# Altium schematic sheet StepperPlotter.SchDoc
size C; SheetNumber: 1; SheetTotal: 1
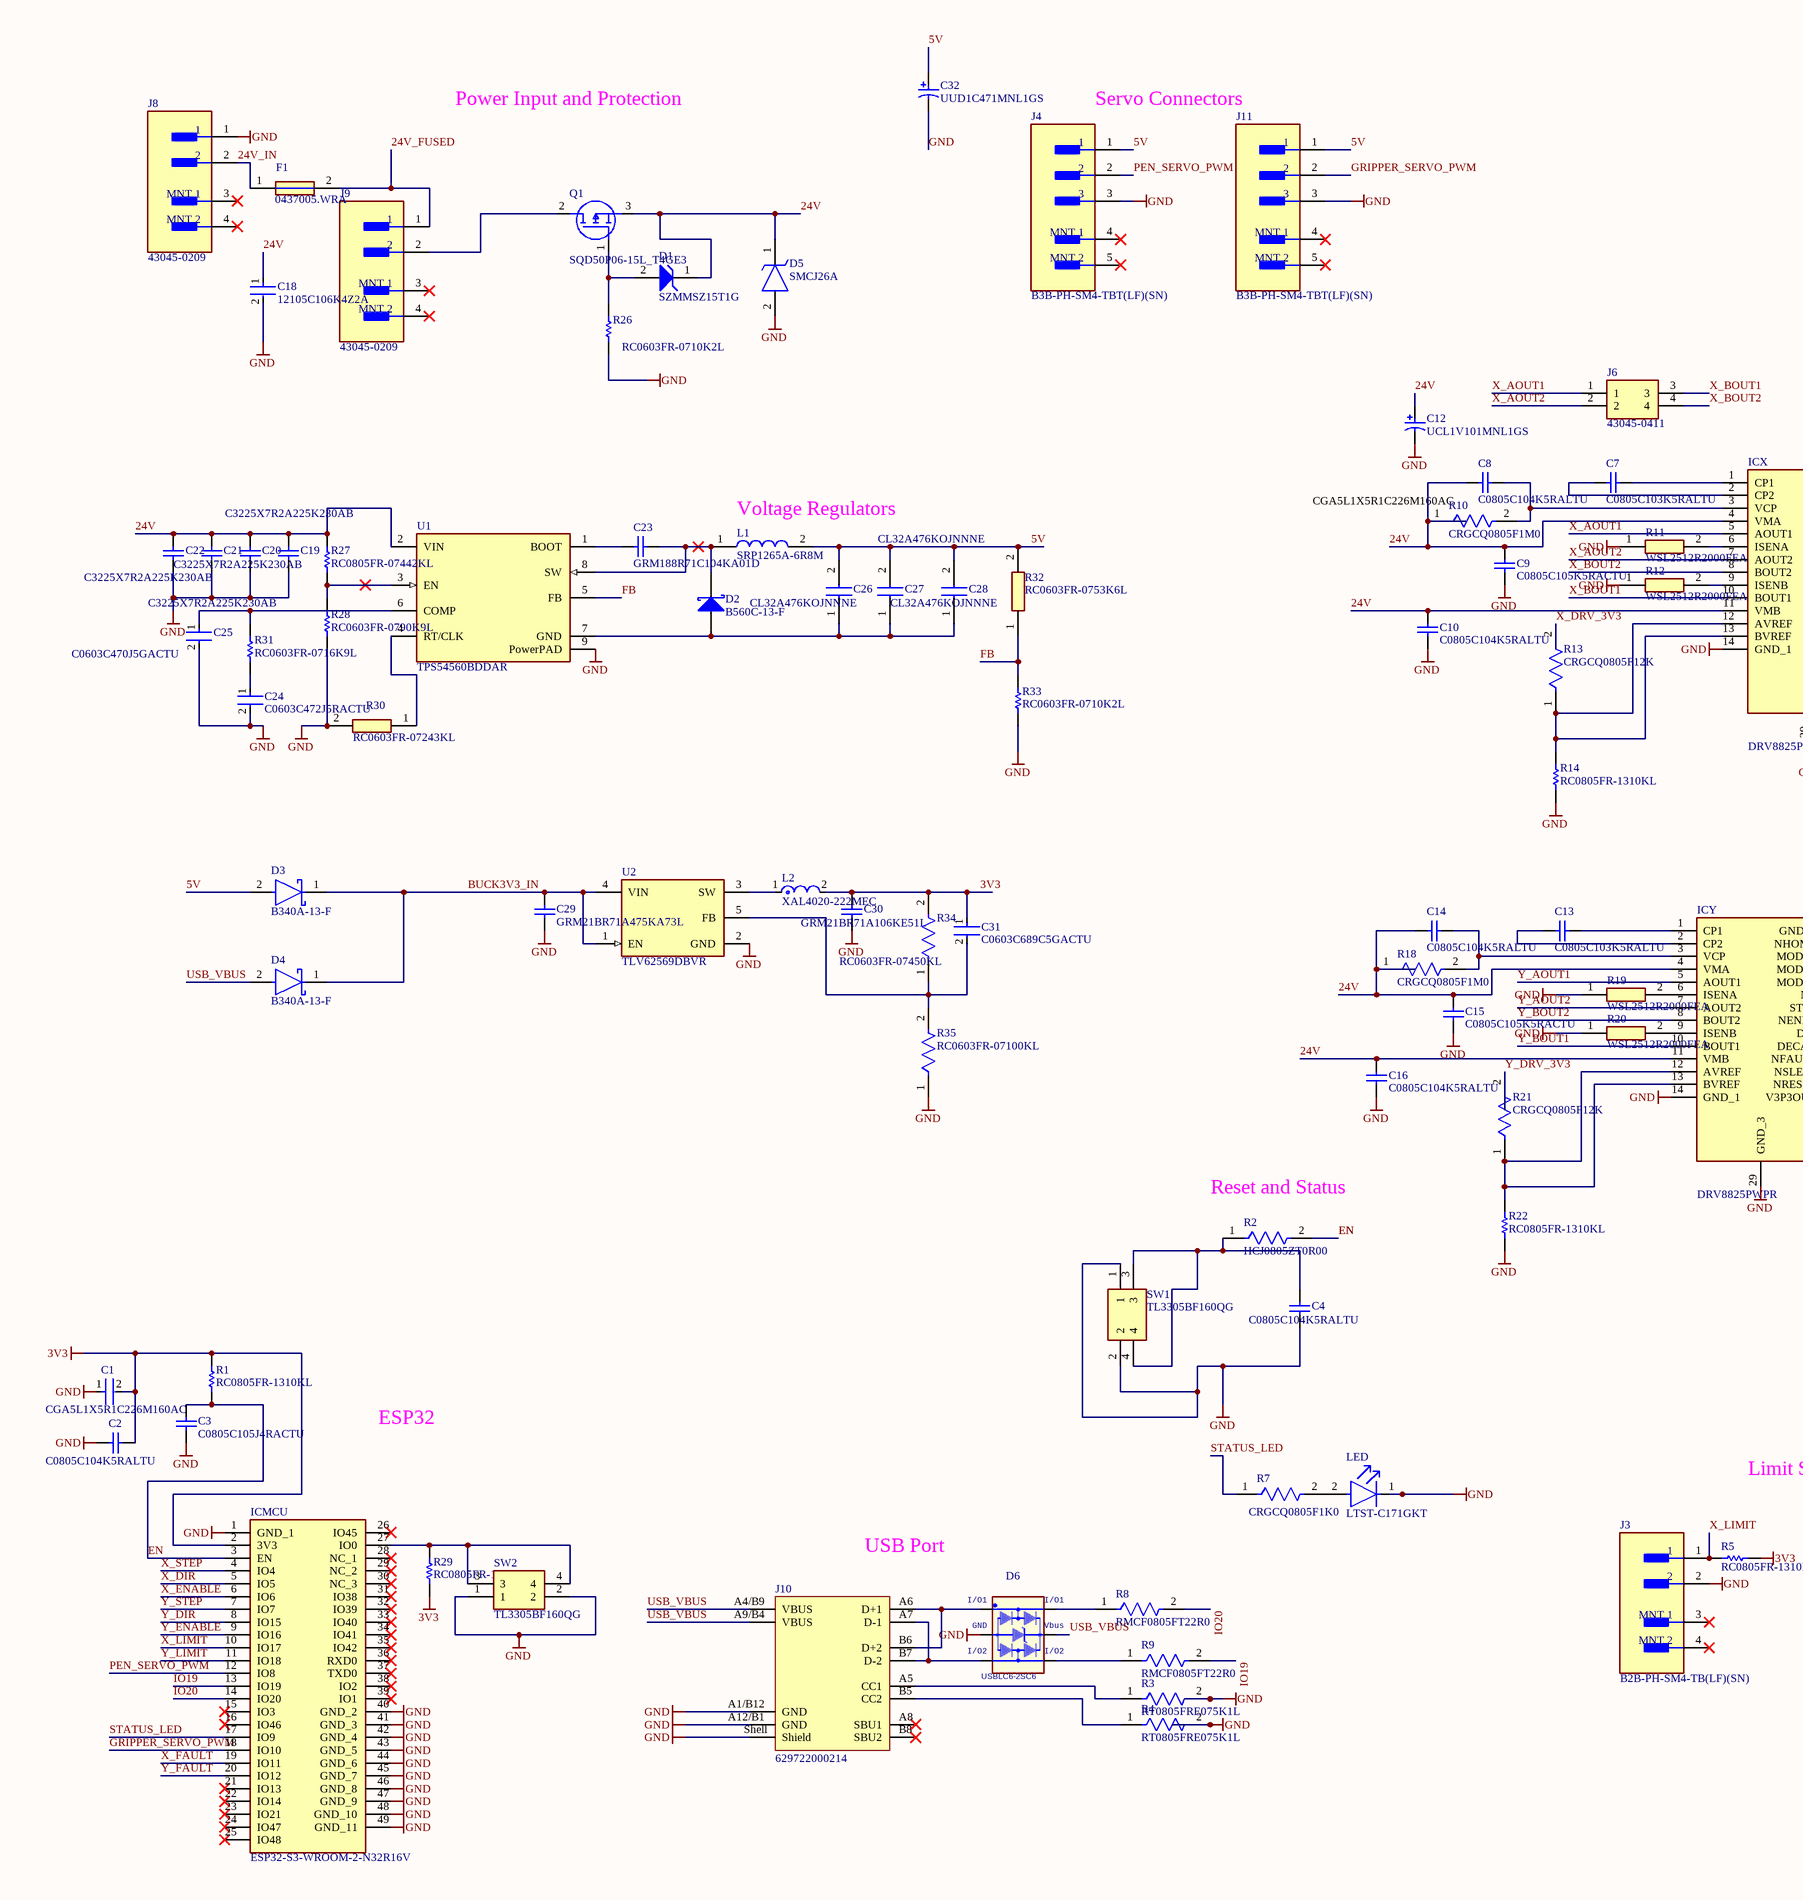
[diagram p0: StepperPlotter.SchDoc, left]
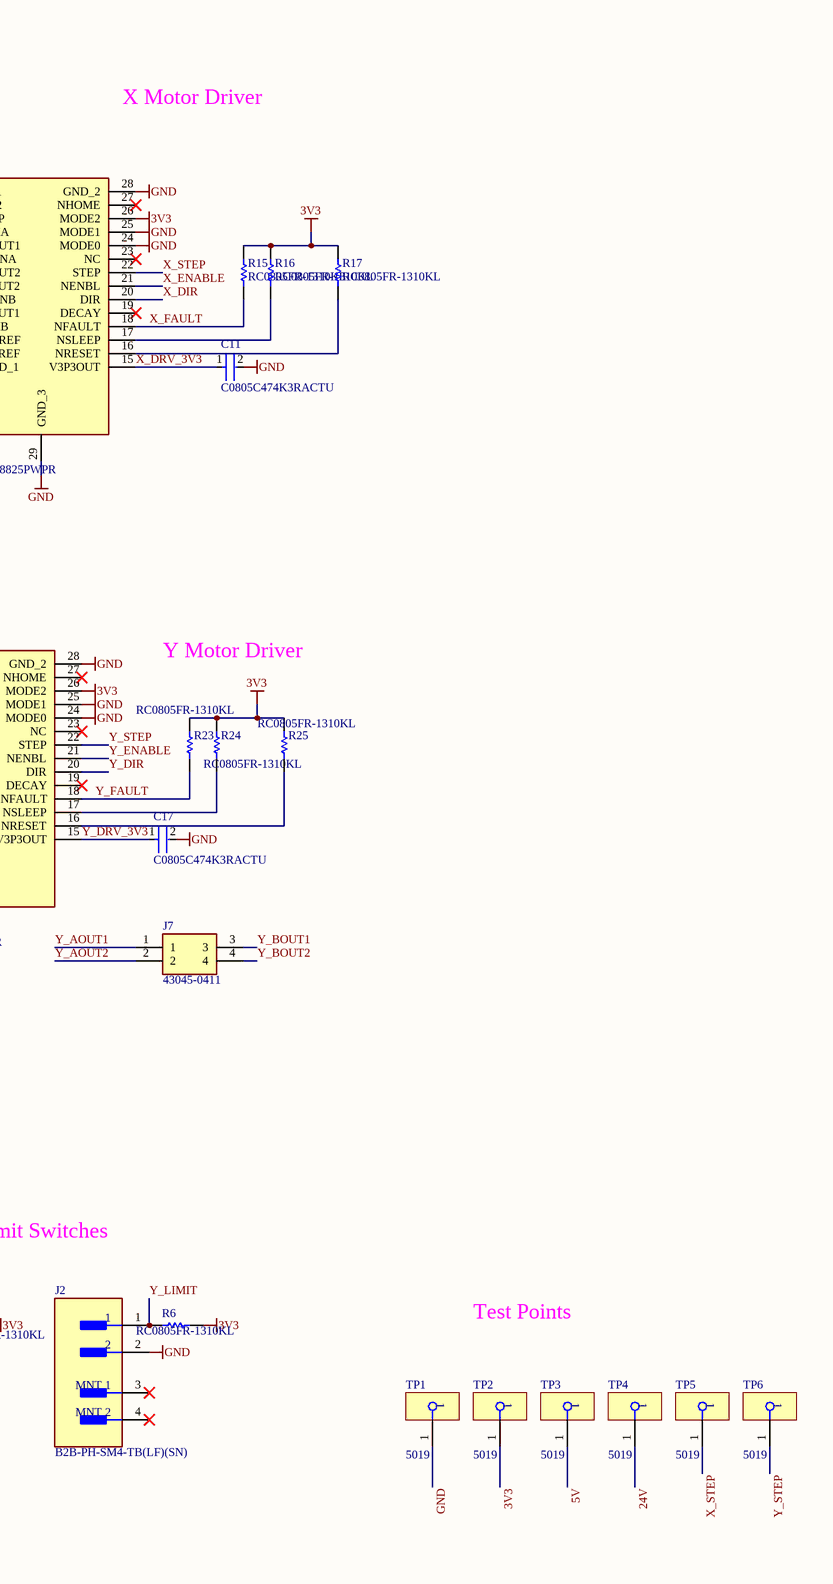
[diagram p1: StepperPlotter.SchDoc, right]

## Parts
C1  CGA5L1X5R1C226M160AC  [FP-CGA5L-0_3-0_1-IPC_A]
C2  C0805C104K5RALTU  [CAPC2013X88X50LL20T25]
C3  C0805C105J4RACTU  [CAPC2013X140X50NL20T25]
C4  C0805C104K5RALTU  [CAPC2013X88X50LL20T25]
C7  C0805C103K5RALTU  [CAPC2013X145X50LL20T25]
C8  C0805C104K5RALTU  [CAPC2013X88X50LL20T25]
C9  C0805C105K5RACTU  [CAPC2013X140X50ML20T25]
C10  C0805C104K5RALTU  [CAPC2013X88X50LL20T25]
C11  C0805C474K3RACTU  [FP-C0805C-DN-MFG]
C12  UCL1V101MNL1GS  [NIC-UCL1V101MNL1GS_L]
C13  C0805C103K5RALTU  [CAPC2013X145X50LL20T25]
C14  C0805C104K5RALTU  [CAPC2013X88X50LL20T25]
C15  C0805C105K5RACTU  [CAPC2013X140X50ML20T25]
C16  C0805C104K5RALTU  [CAPC2013X88X50LL20T25]
C17  C0805C474K3RACTU  [FP-C0805C-DN-MFG]
C18  12105C106K4Z2A  [FP-12105C106K4Z2A-MFG]
C19  C3225X7R2A225K230AB  [CAPC3225X250X20LL40]
C20  C3225X7R2A225K230AB  [CAPC3225X250X20LL40]
C21  C3225X7R2A225K230AB  [CAPC3225X250X20LL40]
C22  C3225X7R2A225K230AB  [CAPC3225X250X20LL40]
C23  GRM188R71C104KA01D  [MURA-0603_H_0.9_M]
C24  C0603C472J5RACTU  [FP-C0603C-CF-MFG]
C25  C0603C470J5GACTU  [FP-C0603C-CF-MFG]
C26  CL32A476KOJNNNE  [CAPC3225X270N]
C27  CL32A476KOJNNNE  [CAPC3225X270N]
C28  CL32A476KOJNNNE  [CAPC3225X270N]
C29  GRM21BR71A475KA73L  [CAPC2013X135X45LL10T25]
C30  GRM21BR71A106KE51L  [CAPC2013X140X45NL15T25]
C31  C0603C689C5GACTU  [FP-C0603C-CF-MFG]
C32  UUD1C471MNL1GS  [NIC-CAPA2-8X10_V]
D1  SZMMSZ15T1G  [ONSC-SOD-123-2-425-04_V]
D2  B560C-13-F  [DIOD-B5X0C-2_M]
D3  B340A-13-F  [FP-SMA-MFG]
D4  B340A-13-F  [FP-SMA-MFG]
D5  SMCJ26A  [SMCJ26A]
D6  USBLC6-2SC6  [ST_SOT23-6L]
F1  0437005.WRA  [FUSC3216X98N]
ICMCU  ESP32-S3-WROOM-2-N32R16V  [ESP32S3WROOM2N32R16V]
ICX  DRV8825PWPR  [SOP65P640X120-29N]
ICY  DRV8825PWPR  [SOP65P640X120-29N]
J2  B2B-PH-SM4-TB(LF)(SN)  [FP-B2B-PH-SM4-TB_LF_SN-MFG]
J3  B2B-PH-SM4-TB(LF)(SN)  [FP-B2B-PH-SM4-TB_LF_SN-MFG]
J4  B3B-PH-SM4-TBT(LF)(SN)  [FP-B3B-PH-SM4-TBT_LF_SN-MFG]
J6  43045-0411  [43045-04YY_09101192]
J7  43045-0411  [43045-04YY_09101192]
J8  43045-0209  [FP-43045-0209-MFG]
J9  43045-0209  [FP-43045-0209-MFG]
J10  629722000214  [629722000214]
J11  B3B-PH-SM4-TBT(LF)(SN)  [FP-B3B-PH-SM4-TBT_LF_SN-MFG]
L1  SRP1265A-6R8M  [INDPM135125X650N]
L2  XAL4020-222MEC  [FP-XAL4020-MFG]
LED  LTST-C171GKT  [FP-LTST-C171GKT-MFG]
Q1  SQD50P06-15L_T4GE3  [SQD50P0615L_T4GE3]
R1  RC0805FR-1310KL  [RESC2013X60X35ML10T20]
R2  HCJ0805ZT0R00  [FP-HCJ0805-MFG]
R3  RT0805FRE075K1L  [FP-RT0805-MFG]
R4  RT0805FRE075K1L  [FP-RT0805-MFG]
R5  RC0805FR-1310KL  [RESC2013X60X35ML10T20]
R6  RC0805FR-1310KL  [RESC2013X60X35ML10T20]
R7  CRGCQ0805F1K0  [FP-CRGCQ0805-IPC_C]
R8  RMCF0805FT22R0  [FP-RMCF0805-IPC_B]
R9  RMCF0805FT22R0  [FP-RMCF0805-IPC_B]
R10  CRGCQ0805F1M0  [FP-CRGCQ0805-IPC_C]
R11  WSL2512R2000FEA  [RESC6332X71N]
R12  WSL2512R2000FEA  [RESC6332X71N]
R13  CRGCQ0805F12K  [FP-CRGCQ0805-IPC_C]
R14  RC0805FR-1310KL  [RESC2013X60X35ML10T20]
R15  RC0805FR-1310KL  [RESC2013X60X35ML10T20]
R16  RC0805FR-1310KL  [RESC2013X60X35ML10T20]
R17  RC0805FR-1310KL  [RESC2013X60X35ML10T20]
R18  CRGCQ0805F1M0  [FP-CRGCQ0805-IPC_C]
R19  WSL2512R2000FEA  [RESC6332X71N]
R20  WSL2512R2000FEA  [RESC6332X71N]
R21  CRGCQ0805F12K  [FP-CRGCQ0805-IPC_C]
R22  RC0805FR-1310KL  [RESC2013X60X35ML10T20]
R23  RC0805FR-1310KL  [RESC2013X60X35ML10T20]
R24  RC0805FR-1310KL  [RESC2013X60X35ML10T20]
R25  RC0805FR-1310KL  [RESC2013X60X35ML10T20]
R26  RC0603FR-0710K2L  [RESC1608X55X25LL10T15]
R27  RC0805FR-07442KL  [RESC2013X60X35LL10T20]
R28  RC0603FR-0790K9L  [RESC1608X55X25LL10T15]
R29  RC0805FR-1310KL  [RESC2013X60X35ML10T20]
R30  RC0603FR-07243KL  [RESC1608X55N]
R31  RC0603FR-0716K9L  [RESC1608X55X25LL10T15]
R32  RC0603FR-0753K6L  [RESC1608X55N]
R33  RC0603FR-0710K2L  [RESC1608X55X25LL10T15]
R34  RC0603FR-07450KL  [FP-RC0603-0_55-MFG]
R35  RC0603FR-07100KL  [FP-RC0603-0_55-MFG]
SW1  TL3305BF160QG  [TL3305BF160QG]
SW2  TL3305BF160QG  [TL3305BF160QG]
TP1  5019  [5019_MFG]
TP2  5019  [5019_MFG]
TP3  5019  [5019_MFG]
TP4  5019  [5019_MFG]
TP5  5019  [5019_MFG]
TP6  5019  [5019_MFG]
U1  TPS54560BDDAR  [FP-DDA0008E-MFG]
U2  TLV62569DBVR  [FP-DBV0005A-MFG]

## Nets
3V3: C1.2 C2.2 C30.2 C31.1 ICMCU.2(3V3) ICX.26(MODE2) ICY.26(MODE2) L2.2 R1.2 R5.1 R6.1 R15.1 R16.1 R17.1 R23.1 R24.1 R25.1 R29.1 R34.2 TP2.1
GND: C1.1 C2.1 C3.1 C4.1 C9.1 C10.1 C11.2 C12.2 C15.1 C16.1 C17.2 C18.2 C19.1 C20.1 C21.1 C22.1 C24.2 C25.2 C29.1 C30.1 C32.2 D5.2(A) D6.2(GND) ICMCU.1(GND_1) ICMCU.40(GND_2) ICMCU.41(GND_3) ICMCU.42(GND_4) ICMCU.43(GND_5) ICMCU.44(GND_6) ICMCU.45(GND_7) ICMCU.46(GND_8) ICMCU.47(GND_9) ICMCU.48(GND_10) ICMCU.49(GND_11) ICX.14(GND_1) ICX.24(MODE0) ICX.25(MODE1) ICX.28(GND_2) ICX.29(GND_3) ICY.14(GND_1) ICY.24(MODE0) ICY.25(MODE1) ICY.28(GND_2) ICY.29(GND_3) J2.2 J3.2 J4.3 J8.1 J10.A1/B12(GND) J10.A12/B1(GND) J10.Shell(Shield) J11.3 LED.1(C) R3.2 R4.2 R11.1 R12.1 R14.2 R19.1 R20.1 R22.2 R26.1 R28.1 R30.2 R33.1 R35.1 SW1.1 SW1.2 SW2.1 SW2.2 TP1.1 U1.9(PowerPAD) U2.2(GND)
5V: C26.2 C27.2 C28.2 C32.1 D3.2(A) J4.1 J11.1 L1.2 R32.2 TP3.1
24V: C8.1 C9.2 C10.2 C12.1 C14.1 C15.2 C16.2 C18.1 C19.2 C20.2 C21.2 C22.2 D1.1(K) D5.1(K) ICX.4(VMA) ICX.11(VMB) ICY.4(VMA) ICY.11(VMB) Q1.3(S) R10.1 R18.1 R27.2 TP4.1 U1.2(VIN)
24V_FUSED: F1.2 J9.1
24V_IN: F1.1 J8.2
BUCK3V3_IN: C29.2 D3.1(C) D4.1(C) U2.1(EN) U2.4(VIN)
EN: C3.2 ICMCU.3(EN) R1.1 R2.2
FB: R32.1 R33.2 U1.5(FB)
GRIPPER_SERVO_PWM: ICMCU.18(IO10) J11.2
IO19: ICMCU.13(IO19) R9.2
IO20: ICMCU.14(IO20) R8.2
PEN_SERVO_PWM: ICMCU.12(IO8) J4.2
STATUS_LED: ICMCU.17(IO9) R7.1
USB_VBUS: D4.2(A) D6.5(Vbus) J10.A4/B9(VBUS) J10.A9/B4(VBUS)
X_AOUT1: ICX.5(AOUT1) J6.1
X_AOUT2: ICX.7(AOUT2) J6.2
X_BOUT1: ICX.10(BOUT1) J6.3
X_BOUT2: ICX.8(BOUT2) J6.4
X_DIR: ICMCU.5(IO5) ICX.20(DIR)
X_DRV_3V3: C11.1 ICX.15(V3P3OUT) R13.2
X_ENABLE: ICMCU.6(IO6) ICX.21(NENBL)
X_FAULT: ICMCU.19(IO11) ICX.18(NFAULT) R15.2
X_LIMIT: ICMCU.10(IO17) J3.1 R5.2
X_STEP: ICMCU.4(IO4) ICX.22(STEP) TP5.1
Y_AOUT1: ICY.5(AOUT1) J7.1
Y_AOUT2: ICY.7(AOUT2) J7.2
Y_BOUT1: ICY.10(BOUT1) J7.3
Y_BOUT2: ICY.8(BOUT2) J7.4
Y_DIR: ICMCU.8(IO15) ICY.20(DIR)
Y_DRV_3V3: C17.1 ICY.15(V3P3OUT) R21.2
Y_ENABLE: ICMCU.9(IO16) ICY.21(NENBL)
Y_FAULT: ICMCU.20(IO12) ICY.18(NFAULT) R23.2
Y_LIMIT: ICMCU.11(IO18) J2.1 R6.2
Y_STEP: ICMCU.7(IO7) ICY.22(STEP) TP6.1
NetC4_2: C4.2 R2.1 SW1.3 SW1.4
NetC7_1: C7.1 ICX.2(CP2)
NetC7_2: C7.2 ICX.1(CP1)
NetC8_2: C8.2 ICX.3(VCP) R10.2
NetC13_1: C13.1 ICY.2(CP2)
NetC13_2: C13.2 ICY.1(CP1)
NetC14_2: C14.2 ICY.3(VCP) R18.2
NetC23_1: C23.1 U1.1(BOOT)
NetC23_2: C23.2 D2.1(K) L1.1 U1.8(SW)
NetC24_1: C24.1 R31.1
NetC25_1: C25.1 R31.2 U1.6(COMP)
NetC26_1: C26.1 C27.1 C28.1 D2.2(A) U1.7(GND)
NetC31_2: C31.2 R34.1 R35.2 U2.5(FB)
NetD1_2: D1.2(A) Q1.1(G) R26.2
NetD6_1: D6.1(I/O1) J10.A6(D+1) J10.B6(D+2)
NetD6_3: D6.3(I/O2) J10.A7(D-1) J10.B7(D-2)
NetD6_4: D6.4(I/O2+) R9.1
NetD6_6: D6.6(I/O1+) R8.1
NetICMCU_27: ICMCU.27(IO0) R29.2 SW2.3 SW2.4
NetICX_6: ICX.6(ISENA) R11.2
NetICX_9: ICX.9(ISENB) R12.2
NetICX_12: ICX.12(AVREF) ICX.13(BVREF) R13.1 R14.1
NetICX_16: ICX.16(NRESET) R17.2
NetICX_17: ICX.17(NSLEEP) R16.2
NetICY_6: ICY.6(ISENA) R19.2
NetICY_9: ICY.9(ISENB) R20.2
NetICY_12: ICY.12(AVREF) ICY.13(BVREF) R21.1 R22.1
NetICY_16: ICY.16(NRESET) R25.2
NetICY_17: ICY.17(NSLEEP) R24.2
NetJ9_2: J9.2 Q1.2(D)
NetJ10_A5: J10.A5(CC1) R3.1
NetJ10_B5: J10.B5(CC2) R4.1
NetL2_1: L2.1 U2.3(SW)
NetLED_2: LED.2(A) R7.2
NetR27_1: R27.1 R28.2 U1.3(EN)
NetR30_1: R30.1 U1.4(RT/CLK)

Not connected (* = marked no-connect by the designer): ICMCU 15(IO3)* 16(IO46)* 21(IO13)* 22(IO14)* 23(IO21)* 24(IO47)* 25(IO48)* 26(IO45)* 28(NC_1)* 29(NC_2)* 30(NC_3)* 31(IO38)* 32(IO39)* 33(IO40)* 34(IO41)* 35(IO42)* 36(RXD0)* 37(TXD0)* 38(IO2)* 39(IO1)*; ICX 19(DECAY)* 23(NC)* 27(NHOME)*; ICY 19(DECAY)* 23(NC)* 27(NHOME)*; J2 3(MNT_1)* 4(MNT_2)*; J3 3(MNT_1)* 4(MNT_2)*; J4 4(MNT_1)* 5(MNT_2)*; J8 3(MNT_1)* 4(MNT_2)*; J9 3(MNT_1)* 4(MNT_2)*; J10 A8(SBU1)* B8(SBU2)*; J11 4(MNT_1)* 5(MNT_2)*

## Notes on the sheet
- Power Input and Protection
- Servo Connectors
- X Motor Driver
- (near L1) Voltage Regulators
- CGA5L1X5R1C226M160AC
- Y Motor Driver
- (near R2) Reset and Status
- ESP32
- Limit Switches
- USB Port
- Test Points

## Library data of the parts
C1 = CMP-08246-001863-1: Cap Ceramic 22uF 16V X5R 20% Pad SMD 1206 +85°C Automotive T/R; Height: 1.6mm; Weight: 0.000571oz; Lead Free: Lead Free; Min Operating Temperature: -55°C; Max Operating Temperature: 85°C; Case Code (Metric): 3216; Capacitance: 22uF; Case Code (Imperial): 1206; Voltage Rating: 16V; Packaging: Tape and Reel; Voltage Rating (DC): 16V; Ratings: AEC-Q200; Length: 0.126inch; Case/Package: 1206; Width: 0.063inch; Package Quantity: 2000; Dielectric: X5R; Thickness: 0.071inch; Mount: Surface Mount; Tolerance: 20%; Termination: SMD/SMT
C2 C4 C8 C10 C14 C16 = CMP-2007-00280-1: Manufacturer: Kemet; Part Number: C0805C104K5RALTU
C3 = CMP-2007-03229-1: Manufacturer: Kemet; Part Number: C0805C105J4RACTU
C7 C13 = CMP-2007-01067-1: Manufacturer: Kemet; Part Number: C0805C103K5RALTU
C9 C15 = CMP-2007-03236-1: Manufacturer: Kemet; Part Number: C0805C105K5RACTU
C11 C17 = CMP-1036-04645-2: CAP CER 0.47UF 25V X7R 0805; Manufacturer: KEMET; Material: Ceramic; Value: 0.47 μF; Tolerance: 0.1; Temperature Coefficient: 30ppm/°C; Lead Free: Yes; Device Class L1: Passive Components; ComponentLink2Description: Datasheet; Category: Cap; Temperature: -55°C to +125°C; RoHS: TRUE; Capacitance: 0.47 μF; Automotive: No; Height: 0.88mm; Digikey Description: CAP CER 0.47UF 25V X7R 0805; Manufacturer Part Number: C0805C474K3RACTU; Device Class L3: Ceramic Capacitors; Package: C0805C-DN; Voltage Rating: 25 V; Octopart: https://octopart.com/c0805c474k3ractu-kemet-90785; Temperature Characteristic: X7R; Temperature Range Low: -55°C; Temperature Range High: +125°C; Device Class L2: Capacitors; Ipc Land Pattern Name: CAPC200125X78; ComponentLink2URL: https://content.kemet.com/datasheets/KEM_C1003_C0G_SMD.pdf
C12 = CMP-2000-07344-1: Aluminum Electrolytic Capacitor, 100 uF, 35 V, 20%, -55 to 105 degC, 2-Pin SMD, RoHS, Tape and Reel; Manufacturer: Nichicon; Capacitance: 100uF; Dissipation Factor DF: 0.12; Case Diameter: 8mm; Ripple Current: 850mA; Type: AluminumElectrolyticCapacitors,ChipType,LowImpedance; Case Height: 8.3mm; Leakage Current: 3uA; Voltage Rating DC: 35V; Load Life: 2000h; Case Length: 10mm; Series: CL; Minimum Operating Temperature: -55C; Datasheet URL: http://datasheet.octopart.com/UCL1V101MNL1GS-Nichicon-datasheet-41194108.pdf; Manufacturer URL: http://www.nichicon.co.jp/english/; Maximum Operating Temperature: +105C; Package Reference: UCL1V101MNL1GS; Operating Temperature Range: -55Cto+105C; Brand: Nichicon; Package Description: 2-Pin Surface Mount Device, Body 8.3 x 8.3 mm, Height 10.8 mm; RoHS: Details; Voltage Rating: 35V; Dimensions: 8mmDia.x10mmLx8.3mmH; Termination Style: SMD/SMT; Datasheet Version: 01/2015; Packaging: Reel; Mounting Technology: SurfaceMount; Product Category: AluminumElectrolyticCapacitors-SMD; Factory Pack Quantity: 500; Product: LowImpedanceElectrolyticCapacitors; Tolerance: 20%
C18 = CMP-04427-000001-1: CAP CER 10UF 50V X7R 1210; Manufacturer: AVX; Temperature Coefficient: 15%; Tolerance: 10%; Material: Ceramic; Automotive Grade: Grade 1; Octopart: https://octopart.com/12105c106k4z2a-avx-81558923; Automotive: Yes; Value: 10uF; Device Class L2: Capacitors; Category: Cap; RoHS: TRUE; Manufacturer Part Number: 12105C106K4Z2A; ComponentLink2Description: Datasheet; Device Class L3: Ceramic Capacitors; Temperature Range Low: -55°C; Height: 2.79mm; Temperature: -55°C to +125°C; Package: 0; Digikey Description: CAP CER 10UF 50V X7R 1210; Voltage Rating: 50V; Footprint Url: http://catalogs.avx.com/SurfaceMount.pdf; Capacitance: 10uF; Ipc Land Pattern Name: CAPC330250X279; Device Class L1: Passive Components; Lead Free: Yes; Temperature Characteristic: X7R; Temperature Range High: +125°C; ComponentLink2URL: http://datasheets.avx.com/AutoMLCC.pdf
C19-C22 = CMP-2000-06053-1: Chip Capacitor, 2.2 uF, +/- 10%, -55 to 125 degC, 1210 (3225 Metric), RoHS, Tape and Reel; PCN Part Number: MLCCPartNumberChange30/Nov/2012; Manufacturer: TDK; Capacitance: 2.2µF; Catalog Drawings: CSERIES_1210_2.5; Product Training Modules: SEAT,CCV,andTVCLDesignToolsGuidetoReplacinganElectrolyticCapacitorwithanMLCC; Other Names: 445-4497-6; Voltage - Rated: 100V; Temperature Coefficient: X7R; Featured Product: C-SeriesMidVoltageMLCCs; Online Catalog: CSeries,MidVoltage; Ratings: -; Mounting Technology: SurfaceMount; Height - Seated (Max): -; Applications: GeneralPurpose; Packaging: Digi-Reel®; Mounting Type: SurfaceMount,MLCC; Lead Spacing: -; Thickness (Max): 0.098"(2.50mm); Package Reference: 1210 (3225 Metric); Manufacturer URL: http://www.tdk.com/; Size / Dimension: 0.126"Lx0.098"W(3.20mmx2.50mm); Operating Temperature: -55°C~125°C; Datasheet URL: https://datasheet.ciiva.com/15192/getdatasheetpartid-725361-15192330.pdf; RoHS Information: RoHSCertificate-MLCC; Lead Style: -; Standard Package: 1; Family: CeramicCapacitors; Datasheet Version: 10/2014; Category: Capacitors; Tolerance: ±10%; Features: -; Series: C; Package Description: 2-Pin Surface Mount Device, Body 3.2 x 2.5 mm; Package / Case: 1210(3225Metric)
C23 = CMP-2000-05253-1: CAP, Ceramic, 0.1 uF, 10%, 16 V, 0603, RoHS, Tape and Reel; Manufacturer: Murata; Capacitance - pF: 100000pF; Case Length: 1.6mm; Voltage Rating DC: 16V; Brand: MurataElectronics; Temperature Coefficient / Code: +/-15%; Case Width: 0.8mm; Type: GeneralPurposeMLCC; Capacitance: 0.1uF; Dielectric: X7R; Capacitance - nF: 100nF; Product Category: MultilayerCeramicCapacitorsMLCC-SMD/SMT; Datasheet URL: https://datasheet.ciiva.com/29202/451467-da-01-en-vs-kondensator-0603-29202287.pdf; Termination Style: SMD/SMT; Operating Temperature Range: -55Cto+125C; Case Code - in: 0603; Datasheet Version: Dec-10; Dimensions: 0.8mmWx1.6mmLx0.8mmH; RoHS: Details; Case Code - mm: 1608; Product: GeneralTypeMLCCs; Voltage Rating: 16V; Package / Case: 0603(1608metric); Factory Pack Quantity: 4000; Packaging: Reel; Maximum Operating Temperature: +125C; Manufacturer URL: http://www.murata.com/; Case Height: 0.8mm; Minimum Operating Temperature: -55C; Series: GRM; Tolerance: 10%
C24 = CMP-1035-02202-3: C0603C 4.7nF Ceramic Multilayer Capacitor; 50 VDC; +125degC; X7R Dielec; +/-5%; Manufacturer: KEMET; Tolerance: 0.05; Capacitance: 4,700 pF; Temperature Coefficient: 30ppm/°C; Value: 4,700 pF; Automotive Grade: Grade 1; Voltage Rating: 50 V; Device Class L2: Capacitors; Temperature Range Low: -55°C; Automotive: Yes; Manufacturer Part Number: C0603C472J5RACTU; Height: 0.87mm; ComponentLink2Description: Datasheet; Mouser Description: Multilayer Ceramic Capacitors MLCC - SMD/SMT 50volts 4700pF X7R 5%; Material: Ceramic; Device Class L3: Ceramic Capacitors; Device Class L1: Passive Components; Category: Cap; Temperature: -55°C to +125°C; Octopart: https://octopart.com/c0603c472j5ractu-kemet-107195; Digikey Description: C0603C 4.7nF Ceramic Multilayer Capacitor; 50 VDC; +125degC; X7R Dielec; +/-5%; Package: C0603C-CF; Lead Free: Yes; RoHS: TRUE; ComponentLink2URL: https://api.kemet.com/component-edge/download/datasheet/C0603C100J5GACAUTO.pdf; Temperature Range High: +125°C; Temperature Characteristic: X7R
C25 = CMP-1035-01063-3: CAP CER 47PF 50V C0G/NP0 0603; Manufacturer: KEMET; Automotive Grade: Grade 1; Material: Ceramic; Tolerance: 0.05; Temperature Coefficient: 30ppm/°C; Temperature Characteristic: C0G; Manufacturer Part Number: C0603C470J5GACTU; Package: C0603C-CF; Capacitance: 47 pF; Device Class L2: Capacitors; Height: 0.87mm; Automotive: Yes; Device Class L3: Ceramic Capacitors; RoHS: TRUE; Category: Cap; Digikey Description: CAP CER 47PF 50V C0G/NP0 0603; Octopart: https://octopart.com/c0603c470j5gactu-kemet-96565; Mouser Description: Capacitor; Ceramic; Cap; 47.0pF; Tol+5%; SMT; Vol-Rtg 50V; C0G; TR; Value: 47 pF; ComponentLink2Description: Datasheet; Voltage Rating: 50 V; Lead Free: Yes; Temperature Range Low: -55°C; ComponentLink2URL: https://api.kemet.com/component-edge/download/datasheet/C0603C100J5GACAUTO.pdf; Device Class L1: Passive Components; Temperature Range High: +125°C; Temperature: -55°C to +125°C
C26-C28 = CL32A476KOJNNNE: Capacitor; Manufacturer_Name: SAMSUNG; Datasheet Link: http://product.samsungsem.com/mlcc/basic-search.do?partNumber=CL32A476KOJNNN; Height: 2.7mm; Manufacturer_Part_Number: CL32A476KOJNNNE; Mouser Part Number: 187-CL32A476KOJNNNE; Mouser Price/Stock: https://www.mouser.co.uk/ProductDetail/Samsung-Electro-Mechanics/CL32A476KOJNNNE?qs=d72FGnIDsgQXYP%252BbBe7Sww%3D%3D; Arrow Part Number: CL32A476KOJNNNE; Arrow Price/Stock: https://www.arrow.com/en/products/cl32a476kojnnne/samsung-electro-mechanics?utm_currency=USD&region=nac
C29 = CMP-2007-03555-1: Manufacturer: Murata; Part Number: GRM21BR71A475KA73L
C30 = CMP-2007-03395-1: Manufacturer: Murata; Part Number: GRM21BR71A106KE51L
C31 = CMP-2006-03271-2: CAP CER 6.8PF 50V NP0 0603; Manufacturer: KEMET; Automotive Grade: Grade 1; Temperature Coefficient: 30ppm/°C; Temperature Characteristic: C0G; Tolerance: 0.25 pF; Material: Ceramic; ComponentLink2URL: https://api.kemet.com/component-edge/download/datasheet/C0603C100J5GACAUTO.pdf; Mouser Description: 0603 C 6.8pF Ceramic Multilayer Capacitor; 50V dc; +125C; C0G Dielectric; +/-0.25pF; Manufacturer Part Number: C0603C689C5GACTU; Temperature Range High: +125°C; Device Class L1: Passive Components; Temperature: -55°C to +125°C; Digikey Description: CAP CER 6.8PF 50V NP0 0603; Device Class L2: Capacitors; Automotive: Yes; Octopart: https://octopart.com/c0603c689c5gactu-kemet-8718591; Category: Cap; ComponentLink2Description: Datasheet; RoHS: TRUE; Capacitance: 6.8 pF; Value: 6.8 pF; Lead Free: Yes; Device Class L3: Ceramic Capacitors; Package: C0603C-CF; Voltage Rating: 50 V; Temperature Range Low: -55°C; Height: 0.87mm
C32 = CMP-0687-00067-1: Aluminum Electrolytic Capacitor, UD Series, Low Impedance, 470 uF, 16 V, + / - 20%, -55 to 105 degC, Chip Type, 8 x 10 mm D x L, Pb-Free, Reel; Manufacturer: Nichicon; Rated Capacitance: 470 uF; Endurance Time: 5000 h; Impedance: 0.17 Ohm; Packing: Dia382mm Reel; Rated Ripple Current (at 100kHz): 450 mA; Rated Voltage: 16 V; Tolerance Rated Capacitance: -20 to 20%; PackageDescription: 2-Pin Surface Mount Device, Diameter 8 mm, Height 10 mm, Pitch 6.5 mm; ComponentLink3URL: http://products.nichicon.co.jp/en/pdf/XJA043/e-ud.pdf; ComponentLink1URL: http://www.nichicon.co.jp/; DatasheetVersion: 08/2012; RoHS: TRUE; Length: 10 mm; ComponentLink1Description: Manufacturer URL; ComponentLink2Description: Datasheet; PackageReference: CAPAE-D8H10; Diameter: 8 mm; ComponentLink2URL: http://products.nichicon.co.jp/en/pdf/XJA043/e-ud.pdf; Mounting Technology: Surface Mount; ComponentLink3Description: Package Specification; PartNumber: UUD1C471MNL1GS
D1 = CMP-1060-00259-1: Zener Voltage Regulator, 500 mW, 2-Pin SOD-123, Pb-Free, Tape and Reel; Manufacturer: On Semiconductor; P Max (W): 0.5; PartNumber: SZMMSZ15T1G; ComponentLink2Description: Datasheet; DatasheetVersion: Rev. 11; Packing: Tape and Reel; ComponentLink2URL: http://www.onsemi.com/pub_link/Collateral/MMSZ2V4T1-D.PDF; ComponentLink3URL: http://www.onsemi.com/pub_link/Collateral/425-04.PDF; RoHS: Pb-Free; PackageReference: SOD-123-2-425-04; PackageVersion: Rev. G, 10/2009; ComponentLink1Description: Manufacturer URL; ComponentLink3Description: Package Specification; ComponentLink1URL: http://www.onsemi.com/; Mounting Technology: Surface Mount; PackageDescription: 2-Pin SOD, Body 1.6 x 2.69 mm
D2 = CMP-2000-05098-2: Schottky Barrier Rectifier, 5 A, 60 V, -55 to 125 degC, 2-Pin SMD, RoHS, Tape and Reel; Ir - Reverse Current: 500uA; Configuration: Single; Ifsm - Forward Surge Current: 100A; Vrrm - Repetitive Reverse Voltage: 60V; Brand: DiodesIncorporated; Vf - Forward Voltage: 0.7V; If - Forward Current: 5A; Unit Weight: 0.007408oz; Type: SchottkyBarrierRectifier; Package / Case: SMC; Manufacturer URL: http://www.diodes.com/; Datasheet URL: https://datasheet.ciiva.com/27052/1538961-27052355.pdf; Factory Pack Quantity: 3000; Height: 2.5mm; Width: 6.22mm; Product Category: SchottkyDiodes&Rectifiers; Minimum Operating Temperature: -55C; Manufacturer: DiodesIncorporated; Datasheet Version: Rev. 7-2, 06/2007; Product: SchottkyDiodes; Maximum Operating Temperature: +125C; Operating Temperature Range: -55Cto+125C; Technology: Si; Length: 7.11mm; RoHS: True; Packaging: Reel; Termination Style: SMD/SMT; Series: B560; Mounting Style: SMD/SMT
D3 D4 = CMP-1667-00003-3: DIODE SCHOTTKY 40V 3A SMA; Max Forward Surge Current (Ifsm): 80A; Forward Voltage: 500mV; Polarity: Standard; Max Reverse Current: 500uA; Capacitance: 250pF; Element Configuration: Single; Mount: Surface Mount; Output Current: 3A; Radiation Hardening: No; Width: 2.92mm; Current Rating: 3A; Termination: SMD/SMT; Voltage: 40V; Series: -; Max Operating Temperature: 125°C; Current: 3A; Max Repetitive Reverse Voltage (Vrrm): 40V; Min Operating Temperature: -55°C; REACH SVHC: No SVHC; Number of Pins: 2; Average Rectified Current: 3A; Contact Plating: Tin; RoHS Compliant: Yes; Max Reverse Voltage (DC): 40V; Packaging: Tape and Reel; Height: 2.3mm; Length: 4.6mm; Case/Package: SMA; Weight: 0.002258oz; Peak Non-Repetitive Surge Current: 80A; Package Quantity: 5000; Lead Free: Lead Free; Forward Current: 3A; Voltage Rating (DC): 40V
D5 = SMCJ26A: TVS Diode (Uni-directional); Manufacturer_Name: Diodes Incorporated; Datasheet Link: https://www.diodes.com/part/view/SMCJ26A; Height: 2.5mm; Manufacturer_Part_Number: SMCJ26A; Mouser Part Number: N/A; Mouser Price/Stock: https://www.mouser.co.uk/ProductDetail/Diodes-Incorporated/SMCJ26A?qs=evjyFmOIEslPh5lV6xS%252BjA%3D%3D
F1 = 0437005.WRA: Fuse; Manufacturer_Name: LITTELFUSE; Datasheet Link: https://cdn1-originals.webdamdb.com/12956_127233627?cache=1686745286&response-content-disposition=inline;filename=Littelfuse_Fuse_437A_Datasheet.pdf&response-content-type=application/pdf&Policy=eyJTdGF0ZW1lbnQiOlt7IlJlc291cmNlIjoiaHR0cCo6Ly9jZG4xLW9yaWdpb; Height: 0.985mm; Manufacturer_Part_Number: 0437005.WRA; Mouser Part Number: 576-0437005.WRA; Mouser Price/Stock: https://www.mouser.co.uk/ProductDetail/Littelfuse/0437005.WRA?qs=cIziFXvMxOV487Hu3fRMBA%3D%3D; Arrow Part Number: 0437005.WRA; Arrow Price/Stock: https://www.arrow.com/en/products/0437005.wra/littelfuse?utm_currency=USD&region=nac
ICMCU = ESP32-S3-WROOM-2-N32R16V: Integrated Circuit; Manufacturer_Name: Espressif Systems; Datasheet Link: https://www.digikey.in/en/products/detail/espressif-systems/ESP32-S3-WROOM-2-N32R16V/25811280; Height: 3.25mm; Manufacturer_Part_Number: ESP32-S3-WROOM-2-N32R16V; Mouser Part Number: 356-SP32S3WM2N32R16V; Mouser Price/Stock: https://www.mouser.co.uk/ProductDetail/Espressif-Systems/ESP32-S3-WROOM-2-N32R16V?qs=%252BHhoWzUJg4Kf%2FwmS40wg%252BQ%3D%3D
ICX ICY = DRV8825PWPR: Integrated Circuit; Manufacturer_Name: Texas Instruments; Datasheet Link: http://www.ti.com/lit/gpn/drv8825; Height: 1.2mm; Manufacturer_Part_Number: DRV8825PWPR; Mouser Part Number: 595-DRV8825PWPR; Mouser Price/Stock: https://www.mouser.co.uk/ProductDetail/Texas-Instruments/DRV8825PWPR?qs=L4ss%2FyqpMWRQV%252B0JWK8r%2FQ%3D%3D; Arrow Part Number: DRV8825PWPR; Arrow Price/Stock: https://www.arrow.com/en/products/drv8825pwpr/texas-instruments.html?utm_currency=USD&region=nac
J2 J3 = CMP-2000-05163-2: CONN HEADER SMD 2POS 2MM; Number of Poles: 2; Max Current Rating: 2A; Gender: Male; Working Voltage: 100V; Mated Stacking Heights: 8.6mm; Contact Resistance: 20mR; Insulation Resistance: 1GR; Number of Contacts: 2; Housing Material: Polyamide; Lead Pitch: 2mm; Packaging: Tape and Reel; Fastening Type: Detent; Contact Finish - Mating: TIN; Width: 5.5mm; Min Operating Temperature: -25°C; Mount: Surface Mount; Current Rating: 2A; Pitch: 2mm; REACH SVHC: No SVHC; Flammability Rating: UL94 V-0; Contact Plating: Tin; Voltage Rating (AC): 100V; Length: 7.95mm; Number of Rows: 1; Max Operating Temperature: 85°C; Connector Type: Header; Height: 9.4mm; Insulation Material: Nylon; Depth: 5mm; Color: White; Termination: Solder; Housing Color: Beige; Contact Mating Length: 0.13inch; Contact Material: Copper Alloy; Orientation: Straight; Contact Type: Male Pin; Lead Free: Lead Free; Voltage Rating: 100V; Series: PH; Number of Positions: 2; Contact Shape: Square; Max Voltage Rating (AC): 100V; Insulation Color: Natural
J4 J11 = CMP-17439-000306-1: CONN HEADER SMD 3POS 2MM; Contact Resistance: 20mR; Max Voltage Rating (AC): 100V; Number of Positions: 3; Pitch: 0.079inch; Mated Stacking Heights: 8.6mm; Max Current Rating: 2A; Fastening Type: Detent; Max Operating Temperature: 85°C; Termination: Solder; Mount: Surface Mount; Contact Finish - Mating: TIN; Min Operating Temperature: -25°C; Housing Color: Beige; Packaging: Tape and Reel; Insulation Color: Natural; Length: 9.95mm; Flammability Rating: UL94 V-0; Connector Type: Header; Contact Material: Copper Alloy; Insulation Material: Nylon; Lead Free: Lead Free; Contact Plating: Tin; Contact Shape: Square; Number of Rows: 1; Color: Natural; Package Quantity: 10; Depth: 5mm; Voltage Rating: 100V; Housing Material: Polyamide; Contact Type: Male Pin; Series: PH; Orientation: Straight; Contact Mating Length: 0.13inch
J6 J7 = 43045-0411: Connector; Manufacturer_Name: Molex; Datasheet Link: https://www.molex.com/pdm_docs/sd/430450209_sd.pdf; Height: 8.77mm; Manufacturer_Part_Number: 43045-0411; Mouser Part Number: 538-43045-0411; Mouser Price/Stock: https://www.mouser.co.uk/ProductDetail/Molex/43045-0411?qs=UeCeOHRHQeZrBAGCFCweeA%3D%3D
J8 J9 = CMP-04776-000435-1: CONN HEADER 2POS RT ANG SMD TIN; Max Voltage Rating (DC): 250.25kV; Gender: Male; Connector Type: Power; Number of Poles: 2; Voltage Rating (AC): 250V; Pitch: 3mm; Current Rating: 5A; Contact Resistance: 10mR; Row Spacing: 0.118inch; Insulation Resistance: 1GR; Glow Wire Compliant: Compliant; Mating Cycles: 30; Packaging: Tray; Number of Contacts: 2; Fastening Type: Ramp; Max Operating Temperature: 105°C; Contact Material: Brass; Contact Type: Male Pin; Voltage Rating: 250V; Package Quantity: 10; Mount: Surface Mount; Working Voltage: 250V; Material: Polymer; Contact Plating: Tin; Housing Color: Black; Series: Micro-Fit 3.0™ 43045; Voltage Rating (DC): 250V; Halogen Free: Low Halogen; Housing Material: Thermoplastic; Number of Circuits: 2; Flammability Rating: UL94 V-0; Termination: Solder; Min Operating Temperature: -40°C; Orientation: Right Angle; Radiation Hardening: No; Number of Positions: 2; Number of Rows: 2; Color: Black; Diameter: 3mm; Lead Free: Lead Free
J10 = CMP-207978-000003-3: Usb Conn, R/a, Type C 2.0, Rcpt, 16POS Rohs Compliant: Yes; Number of Contacts: 12; Current Rating: 5A; Insulation Resistance: 100MΩ; USB Standard: USB 2.0; Voltage Rating: 20V; Gender: Receptacle; Pin Length: 950µm; Max Operating Temperature: 85°C; Number of Pins: 16; Height: 3.51mm; Contact Material: Gold, Nickel; Packaging: Tape and Reel; RoHS: Compliant; Min Operating Temperature: -40°C
L1 = SRP1265A-6R8M: Inductor; Manufacturer_Name: Bourns; Datasheet Link: https://www.bourns.com/docs/Product-Datasheets/SRP1265A.pdf; Height: 6.5mm; Manufacturer_Part_Number: SRP1265A-6R8M; Mouser Part Number: 652-SRP1265A-6R8M; Mouser Price/Stock: https://www.mouser.co.uk/ProductDetail/Bourns/SRP1265A-6R8M?qs=7z%252BmIopC6%2FImzUD5p7zL4g%3D%3D; Arrow Part Number: SRP1265A-6R8M; Arrow Price/Stock: https://www.arrow.com/en/products/srp1265a-6r8m/bourns?utm_currency=USD&region=nac
L2 = CMP-11268-000134-1: Fixed Inductors 2.2uH Shld 20% 5.5A 38.7mOhms AECQ2; Saturation Current: 5.6A; Core Material: Composite; DC Resistance (DCR): 38.7mR; Self Resonant Frequency: 52MHz; Test Frequency: 100kHz; Shielding: Shielded; Length: 4.3mm; Tolerance: 20%; Packaging: Tape and Reel; Height: 2.1mm; Mount: Surface Mount; Termination: SMD/SMT; Lead Free: Contains Lead; Package Quantity: 1000; Inductance: 2.2uH; Series: XAL4020; Min Operating Temperature: -40°C; Max DC Current: 5.5A; Max Operating Temperature: 125°C; Case/Package: SMD/SMT; Inductance Tolerance: 20%; RMS Current (Irms): 5.5A; Width: 4.3mm; RoHS Compliant: Yes
LED = CMP-22017-000007-1: LED GREEN CLEAR CHIP SMD; Luminous Intensity: 12mcd; Lens Color: Colorless; Dominant Wavelength: 569nm; Number of LEDs: 1; Power Dissipation: 100mW; Viewing Angle: 130°; Reverse Voltage: 5V; Test Current: 10mA; Forward Voltage: 2.1V; Wavelength: 585nm; Lens Style: Diffused; Forward Current: 30mA; Height: 0.8mm; Mount: Surface Mount; Package Quantity: 1; Length: 2mm; Case Code (Metric): 2012; Number of Pins: 2; Number of Elements: 1; Packaging: Tape and Reel; Color: Green; Min Operating Temperature: -55°C; Case/Package: 0805; Power Rating: 100mW; Max Operating Temperature: 85°C; Radiation Hardening: No; Depth: 1.25mm; Lens Transparency: Clear; Width: 1.25mm; Lead Free: Lead Free; Case Code (Imperial): 0805; Illumination Color: Green
Q1 = SQD50P06-15L_T4GE3: MOSFET (P-Channel); Manufacturer_Name: Vishay; Datasheet Link: https://www.vishay.com/docs/69098/sqd50p06.pdf; Height: 2.507mm; Manufacturer_Part_Number: SQD50P06-15L_T4GE3; Mouser Part Number: 78-SQD50P06-15LT4GE3; Mouser Price/Stock: https://www.mouser.co.uk/ProductDetail/Vishay-Siliconix/SQD50P06-15L_T4GE3?qs=MLItCLRbWsxH7Xr7SxG8zw%3D%3D; Arrow Part Number: SQD50P06-15L_T4GE3; Arrow Price/Stock: https://www.arrow.com/en/products/sqd50p06-15l-t4ge3/vishay.html?utm_currency=USD&region=nac
R1 R5 R6 R14-R17 R22-R25 R29 = CMP-2001-04513-1: Manufacturer: Yageo; Part Number: RC0805FR-1310KL
R2 = CMP-26527-000104-1: RES 0 OHM JUMPER 1/2W 0805; Resistance: 0mR; Radiation Hardening: No; Case Code (Imperial): 0805; Number of Terminations: 2; Lead Free: Lead Free; Max Operating Temperature: 155°C; Width: 0.049inch; Case Code (Metric): 2012; Height: 0.026inch; Mount: Surface Mount; Min Operating Temperature: -55°C; Packaging: Tape and Reel; Package Quantity: 1; Termination: Wraparound; Length: 0.079inch; RoHS Compliant: Yes; Case/Package: 0805
R3 R4 = CMP-2001-01539-2: RES SMD 5.1K OHM 1% 1/8W 0805; Manufacturer: Yageo; Temperature Coefficient: 50 ppm/°C; Tolerance: 0.0001; Value: 5.1KΩ; Voltage Rating: 150V; Power Rating: 0.125W; Ipc Land Pattern Name: RESC200125X50; Digikey Description: RES SMD 5.1K OHM 1% 1/8W 0805; Composition: Thin Film; Category: Res; Device Class L2: Resistors; Manufacturer Part Number: RT0805FRE075K1L; Octopart: https://octopart.com/rt0805fre075k1l-yageo-1396245; Series: RT; Lead Free: Yes; ComponentLink2URL: http://www.yageo.com/documents/recent/PYu-RT_1-to-0.01_RoHS_L_9.pdf; Height: 0.6mm; Device Class L1: Passive Components; Footprint Url: http://www.yageo.com/exep/pages/download/literatures/PYu-R_Mount_10.pdf; Package: RT0805; Temperature Range Low: -55°C; Automotive: No; RoHS: TRUE; Temperature Range High: +155°C; Resistance: 5.1KΩ; Temperature: -55°C to +155°C; ComponentLink2Description: Datasheet; Mouser Description: Res Thin Film 0805 5.1K Ohm 1% 1/8W ±50ppm/°C Molded SMD SMD Paper T/R; Device Class L3: Chip SMD Resistors
R7 = CMP-03211-004613-1: CRGCQ 0805 1K0 1%; Manufacturer: TE Connectivity; Value: 1KΩ; Power Rating: 0.125W; Temperature Coefficient: ±100ppm/°C; Tolerance: 0.01; Automotive Grade: Grade 685; Voltage Rating: 150V; Digikey Description: CRGCQ 0805 1K0 1%; Octopart: https://octopart.com/crgcq0805f1k0-te+connectivity-91018154; ComponentLink2Description: Datasheet; Ipc Land Pattern Name: RESC200125X55; Device Class L2: Resistors; Device Class L1: Passive Components; Category: Res; Device Class L3: Chip SMD Resistors; Temperature Range Low: -55°C; Temperature Range High: +155°C; Automotive: Yes; Height: 0.65mm; Resistance: 1KΩ; ComponentLink2URL: https://www.te.com/commerce/DocumentDelivery/DDEController?Action=showdoc&DocId=Data+Sheet%7F1773204-3%7F1%7Fpdf%7FEnglish%7FENG_DS_1773204-3_1.pdf%7F4-2176341-694; Manufacturer Part Number: CRGCQ0805F1K0; Series: CRGCQ; Temperature: -55°C to +155°C; Composition: Thick Film; Lead Free: Yes; RoHS: TRUE; Ambient Temperature Range High: +70°C; Package: CRGCQ0805
R8 R9 = CMP-26527-001086-1: 22Ω ±1% 0.125W 0805 Thick Film Chip Resistor AEC-Q200 compliant; Max Power Dissipation: 125mW; Resistance: 22R; Temperature Coefficient: 100ppm/°C; Case Code (Metric): 2012; Height: 0.026inch; Max Operating Temperature: 155°C; Lead Free: Lead Free; Size Code: 0805; Features: Automotive AEC-Q200; Power Rating: 125mW; RoHS Compliant: Yes; Number of Terminations: 2; Mount: Surface Mount; Min Operating Temperature: -55°C; Tolerance: 1%; Case Code (Imperial): 0805; Packaging: Tape and Reel; Radiation Hardening: No; Series: RMCF; Width: 0.049inch; Contact Plating: Tin; Resistor Type: Thick Film; Case/Package: 0805; Length: 0.079inch
R10 R18 = CMP-03211-002463-1: CRGCQ0805 1MΩ 0.125W ±100ppm/°C 1% 150V; Manufacturer: TE Connectivity; Tolerance: 0.01; RoHS: TRUE; Series: CRGCQ; Composition: Thick Film; Package: CRGCQ0805; ComponentLink2Description: Datasheet; Temperature Coefficient: ±100ppm/°C; Device Class L3: Chip SMD Resistors; Device Class L1: Passive Components; Power Rating: 0.125W; Temperature Range Low: -55°C; Device Class L2: Resistors; Ipc Land Pattern Name: RESC200125X55; Automotive Grade: Grade 1369; Ambient Temperature Range High: +70°C; Value: 1MΩ; Octopart: https://octopart.com/crgcq0805f1m0-te+connectivity-91018158; Manufacturer Part Number: CRGCQ0805F1M0; Voltage Rating: 150V; Lead Free: Yes; Temperature: -55°C to +155°C; Temperature Range High: +155°C; Resistance: 1MΩ; Height: 0.65mm; Automotive: Yes; Category: Res; ComponentLink2URL: https://www.te.com/commerce/DocumentDelivery/DDEController?Action=showdoc&DocId=Data+Sheet%7F1773204-3%7F1%7Fpdf%7FEnglish%7FENG_DS_1773204-3_1.pdf%7F4-2176341-1378
R11 R12 R19 R20 = WSL2512R2000FEA: Resistor; Manufacturer_Name: Vishay; Manufacturer_Part_Number: WSL2512R2000FEA; Mouser Part Number: 71-WSL2512R2000FEA; Mouser Price/Stock: https://www.mouser.co.uk/ProductDetail/Vishay-Dale/WSL2512R2000FEA?qs=fncU5wK7Cm%2FRnWTZ2GANxw%3D%3D; Arrow Part Number: WSL2512R2000FEA; Arrow Price/Stock: https://www.arrow.com/en/products/wsl2512r2000fea/vishay
R13 R21 = CMP-03211-010457-1: CRGCQ 0805 12K 1%; Manufacturer: TE Connectivity; Automotive Grade: Grade 929; Tolerance: 0.01; Voltage Rating: 150V; Power Rating: 0.125W; Resistance: 12KΩ; Value: 12KΩ; Temperature Coefficient: ±100ppm/°C; Ipc Land Pattern Name: RESC200125X55; Temperature Range High: +155°C; Automotive: Yes; Ambient Temperature Range High: +70°C; Digikey Description: CRGCQ 0805 12K 1%; ComponentLink2Description: Datasheet; Height: 0.65mm; ComponentLink2URL: https://www.te.com/commerce/DocumentDelivery/DDEController?Action=showdoc&DocId=Data+Sheet%7F1773204-3%7F1%7Fpdf%7FEnglish%7FENG_DS_1773204-3_1.pdf%7F4-2176341-938; Device Class L2: Resistors; Manufacturer Part Number: CRGCQ0805F12K; RoHS: TRUE; Temperature Range Low: -55°C; Octopart: https://octopart.com/crgcq0805f12k-te+connectivity-91018144; Category: Res; Composition: Thick Film; Package: CRGCQ0805; Device Class L3: Chip SMD Resistors; Temperature: -55°C to +155°C; Device Class L1: Passive Components; Lead Free: Yes; Series: CRGCQ
R26 R33 = CMP-2000-06926-1: Chip Resistor, 10.2 KOhm, +/- 1%, 0.1 W, -55 to 155 degC, 0603 (1608 Metric), RoHS, Tape and Reel; Brand: Yageo; Power Rating: 100mW; Voltage Rating: 75V; Resistance: 10.2kOhms; Unit Weight: 0.000071oz; Temperature Coefficient: 100PPM/C; Package Reference: 0603; Product: ThickFilmResistorsGeneralPurpose; Series: RC; Tolerance: 1%; Datasheet Version: Rev. 7, 05/2017; Case Code - in: 0603; Packaging: Reel; Manufacturer URL: http://www.yageo.com/; Manufacturer: Yageo; Package / Case: 0603(1608metric); Width: 0.8mm; Operating Temperature Range: -55Cto+155C; Package Description: 2-Pin Surface Mount Device, Body 1.6 x 0.8 mm; RoHS: True; Height: 0.45mm; Termination Style: SMD/SMT; Product Category: ThickFilmResistors; Type: GeneralPurposeChipResistorSurfaceMount; Case Code - mm: 1608; Datasheet URL: http://www.yageo.com/documents/recent/PYu-RC_Group_51_RoHS_L_7.pdf; Length: 1.6mm; Mounting Technology: SurfaceMount
R27 = CMP-2001-01150-1: Manufacturer: Yageo; Part Number: RC0805FR-07442KL
R28 = CMP-2000-04158-1: Manufacturer: Yageo; Part Number: RC0603FR-0790K9L
R30 = RC0603FR-07243KL: Resistor; Manufacturer_Name: Yageo Group; Datasheet Link: https://www.yageo.com/upload/media/product/products/datasheet/rchip/PYu-RC_Group_51_RoHS_L_12.pdf; Height: 0.55mm; Manufacturer_Part_Number: RC0603FR-07243KL; Mouser Part Number: 603-RC0603FR-07243KL; Mouser Price/Stock: https://www.mouser.co.uk/ProductDetail/YAGEO/RC0603FR-07243KL?qs=diQw95jMAePbFPASVkscuQ%3D%3D; Arrow Part Number: RC0603FR-07243KL; Arrow Price/Stock: https://www.arrow.com/en/products/rc0603fr-07243kl/yageo?region=nac
R31 = CMP-2000-04913-1: Manufacturer: Yageo; Part Number: RC0603FR-0716K9L
R32 = RC0603FR-0753K6L: Resistor; Manufacturer_Name: Yageo Group; Datasheet Link: http://www.yageo.com/documents/recent/PYu-RC0603_51_RoHS_L_v5.pdf; Height: 0.55mm; Manufacturer_Part_Number: RC0603FR-0753K6L; Mouser Part Number: 603-RC0603FR-0753K6L; Mouser Price/Stock: https://www.mouser.co.uk/ProductDetail/Yageo/RC0603FR-0753K6L?qs=gt6vzsuosg0%252BW6FzaoM1FQ%3D%3D; Arrow Part Number: RC0603FR-0753K6L; Arrow Price/Stock: https://www.arrow.com/en/products/rc0603fr-0753k6l/yageo
R34 = CMP-2100-03662-2: RES SMD 450K OHM 1% 1/10W 0603; Voltage Rating (DC): 50V; Resistance: 450kR; Max Power Dissipation: 100mW; Temperature Coefficient: 100ppm/°C; Working Voltage: 75V; Length: 1.6mm; Lead Free: Lead Free; Number of Terminations: 2; Packaging: Tape and Reel; Voltage Rating: 50V; Termination: SMD/SMT; Width: 0.8mm; Resistor Type: Thick Film; Resistance Tolerance: 1%; Features: Moisture Resistant; Height: 0.45mm; Construction: Rectangular; Case/Package: 0603; Military Standard: Not; Case Code (Imperial): 0603; Series: RC; Technology: THICK FILM; Depth: 0.8mm; RoHS Compliant: Yes; REACH SVHC: No SVHC; Min Operating Temperature: -55°C; Case Code (Metric): 1608; Max Operating Temperature: 155°C; Power Rating: 100mW; Number of Pins: 2; Tolerance: 1%
R35 = CMP-2100-03662-2: RES SMD 100K OHM 1% 1/10W 0603; Voltage Rating (DC): 50V; Resistance: 100kR; Max Power Dissipation: 100mW; Temperature Coefficient: 100ppm/°C; Working Voltage: 75V; Length: 1.6mm; Lead Free: Lead Free; Number of Terminations: 2; Packaging: Tape and Reel; Voltage Rating: 50V; Termination: SMD/SMT; Width: 0.8mm; Resistor Type: Thick Film; Resistance Tolerance: 1%; Features: Moisture Resistant; Height: 0.45mm; Construction: Rectangular; Case/Package: 0603; Military Standard: Not; Case Code (Imperial): 0603; Series: RC; Technology: THICK FILM; Depth: 0.8mm; RoHS Compliant: Yes; REACH SVHC: No SVHC; Min Operating Temperature: -55°C; Case Code (Metric): 1608; Max Operating Temperature: 155°C; Power Rating: 100mW; Number of Pins: 2; Tolerance: 1%
SW1 SW2 = TL3305BF160QG: Switch; Manufacturer_Name: E-Switch; Datasheet Link: https://configured-product-images.s3.amazonaws.com/2D/specs/TL3313AF160QG.pdf; Height: 5.25mm; Manufacturer_Part_Number: TL3305BF160QG; Mouser Part Number: 612-TL3305BF160QG; Mouser Price/Stock: https://www.mouser.co.uk/ProductDetail/E-Switch/TL3305BF160QG?qs=UrFqKgNWc7SMzrRgAbHJ9w%3D%3D
TP1-TP6 = CMP-1672-00008-3: Phosphor Bronze Contact Miniature Silver Plated Surface Mount Test Points; Number of Contacts: 1; ComponentLink1Description: Manufacturer's Website; Number of Pins: 1; Height: 2.42mm; Mount: Surface Mount; HelpURL: https://www.keyelco.com/product-pdf.cfm?p=1357; REACH SVHC: Yes; Packaging: Tape and Reel; Lead Free: Lead Free; ComponentLink1URL: http://www.keyelco.com/; Termination: SMD/SMT; Material: Bronze; Contact Plating: Silver; Contact Material: Silver; RoHS: Compliant; ComponentLink2URL: https://www.keyelco.com/product-pdf.cfm?p=1357; China RoHS: Compliant; Lifecycle Status: Production; ComponentLink2Description: Datasheet URL
U1 = CMP-04918-000346-1: IC REG CTRLR
U2 = CMP-04918-000387-1: IC REG BUCK ADJ 2A SOT23-5; Output Configuration: Positive; Min Output Voltage: 600mV; Max Output Voltage: 5.5V; Switching Frequency: 1.5MHz; Output Type: Adjustable; Synchronous Rectifier: Yes; Min Input Voltage: 2.5V; Output Current: 2A; Mount: Surface Mount; Min Operating Temperature: -40°C; Max Operating Temperature: 125°C; RoHS Compliant: Yes; Max Input Voltage: 5.5V; Case/Package: SOT-23-5; Packaging: Cut Tape